# Altium project MCD_Board.PrjPcb (part 2 of 2)

## Sheet Motor_Driver_Sheet.SchDoc
size A4; DocumentNumber: 4; SheetNumber: 5; SheetTotal: 6
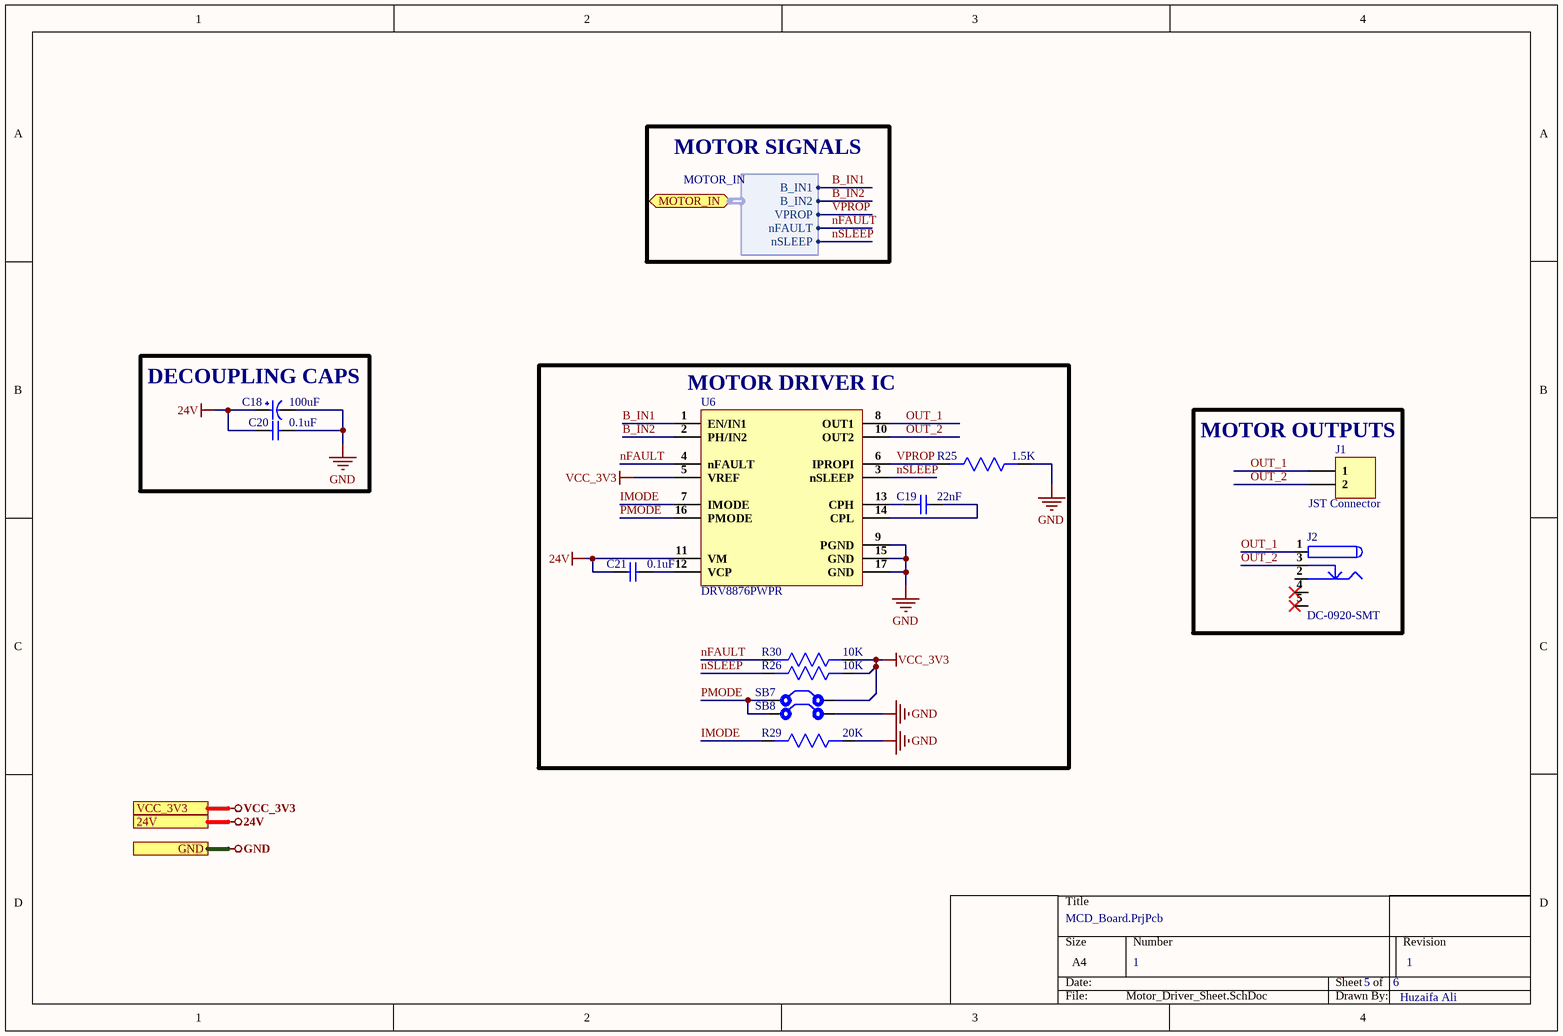
[diagram p3: Motor_Driver_Sheet.SchDoc]

### Parts
C18  100uF  [UWX1E101MCL1GB]
C19  22nF  [Cap 0603]
C20  0.1uF  [Cap 0402]
C21  0.1uF  [Cap 0402]
J1  JST Connector  [JST Connector]
J2  DC-0920-SMT  [DC-0920-SMT]
R25  1.5K  [Res-0201]
R26  10K  [Res0402]
R29  20K  [Res0402]
R30  10K  [Res0402]
SB7  Solder Bridge  [Solder Bridge]  (value not drawn)
SB8  Solder Bridge  [Solder Bridge]  (value not drawn)
U6  DRV8876PWPR  [16HTSSOP]

### Blocks framed on the sheet
DECOUPLING CAPS: C18 C20
MOTOR DRIVER IC: C19 C21 R25 R26 R29 R30 SB7 SB8 U6
MOTOR OUTPUTS: J1 J2

### Ports
24V, GND, MOTOR_IN (bidir, harness MOTOR_IN), VCC_3V3

### Harnesses
MOTOR_IN: B_IN1, B_IN2, VPROP, nFAULT, nSLEEP

### Nets
24V: C18.1 C20.1 C21.1 U6.11(VM) ; port 24V
GND: C18.2 C20.2 R25.1 R29.1 SB8.2 U6.9(PGND) U6.15(GND) U6.17(GND) ; port GND
VCC_3V3: R26.1 R30.1 SB7.2 U6.5(VREF) ; port VCC_3V3
B_IN1: U6.1(EN/IN1) ; port MOTOR_IN.B_IN1
B_IN2: U6.2(PH/IN2) ; port MOTOR_IN.B_IN2
IMODE: R29.2 U6.7(IMODE)
nFAULT: R30.2 U6.4(nFAULT) ; port MOTOR_IN.nFAULT
nSLEEP: R26.2 U6.3(nSLEEP) ; port MOTOR_IN.nSLEEP
OUT_1: J1.1 J2.1 U6.8(OUT1)
OUT_2: J1.2 J2.3 U6.10(OUT2)
PMODE: SB7.1 SB8.1 U6.16(PMODE)
VPROP: R25.2 U6.6(IPROPI) ; port MOTOR_IN.VPROP
NetC19_1: C19.1 U6.13(CPH)
NetC19_2: C19.2 U6.14(CPL)
NetC21_2: C21.2 U6.12(VCP)

Not connected (* = marked no-connect by the designer): J2 2 4* 5*

### Notes on the sheet
- MOTOR SIGNALS
- 1
- Huzaifa Ali

### Library data of the parts
C18 = UWX1E101MCL1GB: CAP ALUM 100UF 20% 25V SMD; Manufacturer: Nichicon; Dielectric Material: Aluminium; Ripple Current: 110mA; Polarity: Polar; Leakage Current: 3uA; Life (Hours): 2000Hour; Dissipation Factor: 0.14%; Lead Diameter: 0.8mm; Supplier 1: Digi-Key; Manufacturer Part Number: UWX1E101MCL1GB; Stock 1: 30613; Pricing 1: 1=0.43, 10=0.301, 50=0.211, 100=0.1808, 500=0.13558 (USD); Mount: Surface Mount; Case/Package: Radial; Number of Pins: 2; Weight: 0.01lb; Min Operating Temperature: -40°C; Max Operating Temperature: 85°C; Capacitance: 100uF; Tolerance: 20%; Ripple Current (AC): 110mA; Voltage Rating: 25V; Packaging: Tape and Reel; Package Quantity: 1000; Voltage Rating (DC): 25V; Termination: SMD/SMT; Voltage: 25V; Series: WX; Construction: Cylindrical; Diameter: 8mm; Length: 5.4mm; Width: 0.25inch; Height: 5.4mm; Lead Pitch: 2.3mm; Height - Seated (Max): 0.213inch; Radiation Hardening: No; REACH SVHC: No SVHC; Lead Free: Lead Free; RoHS Compliant: Yes; ComponentLink1URL: http://nichicon-us.com/english/products/pdfs/e-uwx.pdf?src-supplier=Digi-Key; ComponentLink1Description: http://nichicon-us.com/english/products/pdfs/e-uwx.pdf?src-supplier=Digi-Key; ComponentLink2URL: http://www.nichicon.co.jp/english/products/pdfs/e-ch_ref.pdf?src-supplier=Mouser; ComponentLink2Description: http://www.nichicon.co.jp/english/products/pdfs/e-ch_ref.pdf?src-supplier=Mouser; ComponentLink3URL: http://www.nichicon.co.jp/english/products/pdfs/e-wx.pdf?src-supplier=Avnet; ComponentLink3Description: http://www.nichicon.co.jp/english/products/pdfs/e-wx.pdf?src-supplier=Avnet; ComponentLink4URL: http://uk.rs-online.com/webdocs/0fa3/0900766b80fa3a90.pdf?src-supplier=RSComponents; ComponentLink4Description: http://uk.rs-online.com/webdocs/0fa3/0900766b80fa3a90.pdf?src-supplier=RSComponents; ComponentLink5URL: http://nichicon-us.com/english/products/pdfs/e-wx.pdf?src-supplier=Future+Electronics; ComponentLink5Description: http://nichicon-us.com/english/products/pdfs/e-wx.pdf?src-supplier=Future+Electronics; ComponentLink6URL: http://www.nichicon.co.jp/english/products/pdfs/e-ch_ref.pdf?src-supplier=Avnet+Europe; ComponentLink6Description: http://www.nichicon.co.jp/english/products/pdfs/e-ch_ref.pdf?src-supplier=Avnet+Europe; ComponentLink7URL: http://www.farnell.com/datasheets/2364658.pdf?src-supplier=Element14; ComponentLink7Description: http://www.farnell.com/datasheets/2364658.pdf?src-supplier=Element14; Supplier Part Number 1: 493-2113-6-ND; Supplier 2: Digi-Key; RoHS: Yes; Category: Aluminum Electrolytic Capacitors; Stock 2: 25010; Pricing 2: 1=0.43000, 10=0.30100, 50=0.21100, 100=0.18080, 500=0.13558 (USD); ComponentLink8URL: https://datasheet.ciiva.com/11778/0900766b80fa3a90-11778418.pdf?src-supplier=RSComponents; ComponentLink8Description: https://datasheet.ciiva.com/11778/0900766b80fa3a90-11778418.pdf?src-supplier=RSComponents; ComponentLink9URL: https://datasheet.ciiva.com/17527/e-wx-17527624.pdf?src-supplier=Avnet+Europe; ComponentLink9Description: https://datasheet.ciiva.com/17527/e-wx-17527624.pdf?src-supplier=Avnet+Europe; ComponentLink10URL: https://datasheet.ciiva.com/5361/e-wx-11809-5361100.pdf?src-supplier=Mouser; ComponentLink10Description: https://datasheet.ciiva.com/5361/e-wx-11809-5361100.pdf?src-supplier=Mouser; ComponentLink11URL: https://datasheet.ciiva.com/28458/1912851-28458684.pdf?src-supplier=Element14; ComponentLink11Description: https://datasheet.ciiva.com/28458/1912851-28458684.pdf?src-supplier=Element14; ComponentLink12URL: https://datasheet.ciiva.com/96/e-wx-96650.pdf?src-supplier=Digi-Key; ComponentLink12Description: https://datasheet.ciiva.com/96/e-wx-96650.pdf?src-supplier=Digi-Key; ComponentLink13URL: https://datasheet.ciiva.com/96/e-wx-96651.pdf?src-supplier=Digi-Key; ComponentLink13Description: https://datasheet.ciiva.com/96/e-wx-96651.pdf?src-supplier=Digi-Key; ComponentLink14URL: https://datasheet.ciiva.com/96/e-wx-96652.pdf?src-supplier=Digi-Key; ComponentLink14Description: https://datasheet.ciiva.com/96/e-wx-96652.pdf?src-supplier=Digi-Key; ComponentLink15URL: https://datasheet.ciiva.com/11687/e-wx-11687148.pdf?src-supplier=Avnet; ComponentLink15Description: https://datasheet.ciiva.com/11687/e-wx-11687148.pdf?src-supplier=Avnet; ComponentLink16URL: https://datasheet.ciiva.com/16512/e-wx-16512638.pdf?src-supplier=Future+Electronics; ComponentLink16Description: https://datasheet.ciiva.com/16512/e-wx-16512638.pdf?src-supplier=Future+Electronics; Supplier Part Number 2: 493-2113-1-ND
C19 = CGA3E2X7R2A223K080AA: CAP CER 0.022UF 100V X7R 0603; Manufacturer: TDK; Tolerance: 10%; Supplier 1: Digi-Key; Manufacturer Part Number: CGA3E2X7R2A223K080AA; RoHS: Yes; Category: Ceramic Capacitors; Stock 1: 56079; Pricing 1: 1=0.11000, 10=0.07600, 50=0.04340, 100=0.03590, 500=0.02516, 1000=0.02083 (USD); Mount: Surface Mount; Case/Package: 0603; Case Code (Metric): 1608; Case Code (Imperial): 0603; Weight: 7.1E-05oz; Min Operating Temperature: -55°C; Max Operating Temperature: 125°C; Capacitance: 22nF; Voltage Rating: 100V; Packaging: Tape and Reel; Voltage Rating (DC): 100V; Dielectric: X7R; Termination: SMD/SMT; Series: CGA; Package Quantity: 1; Resistor Type: Ceramic; Length: 1.6mm; Width: 0.031inch; Height: 0.8mm; Thickness: 0.035inch; Depth: 0.8mm; Ratings: AEC-Q200; RoHS Compliant: Yes; REACH SVHC: No SVHC; ComponentLink1URL: https://datasheet.ciiva.com/22725/1735406-22725648.pdf?src-supplier=Element14; ComponentLink1Description: https://datasheet.ciiva.com/22725/1735406-22725648.pdf?src-supplier=Element14; ComponentLink2URL: https://datasheet.ciiva.com/24218/cga3e2x7r2a223k080aa-266292-24218959.pdf?src-supplier=Mouser; ComponentLink2Description: https://datasheet.ciiva.com/24218/cga3e2x7r2a223k080aa-266292-24218959.pdf?src-supplier=Mouser; ComponentLink3URL: https://datasheet.ciiva.com/7975/1807242-7975349.pdf?src-supplier=Element14; ComponentLink3Description: https://datasheet.ciiva.com/7975/1807242-7975349.pdf?src-supplier=Element14; Supplier Part Number 1: 445-5814-1-ND
C20 C21 = CC0402KRX7R7BB104: CAP CER 0.1UF 16V X7R 0402; Manufacturer: Yageo; Tolerance: 10%; Capacitance: 100nF; Supplier 1: Digi-Key; Manufacturer Part Number: CC0402KRX7R7BB104; Stock 1: 16982736; Pricing 1: 1=0.1, 10=0.034, 100=0.015, 500=0.0107, 1000=0.00841, 2500=0.00764, 5000=0.00703 (USD); Mount: Surface Mount; Case/Package: 0402; Number of Pins: 2; Case Code (Metric): 1005; Case Code (Imperial): 0402; Min Operating Temperature: -55°C; Max Operating Temperature: 125°C; Dielectric: X7R; Voltage Rating: 16V; Voltage Rating (DC): 16V; Packaging: Tape and Reel; Package Quantity: 1; Termination: SMD/SMT; Composition: Ceramic; Voltage: 16V; Length: 1mm; Height: 0.5mm; Width: 0.02inch; Thickness: 0.022inch; Depth: 0.5mm; Radiation Hardening: No; REACH SVHC: No SVHC; Lead Free: Lead Free; Halogen Free: Halogen Free; ComponentLink1URL: http://www.yageo.com/documents/recent/UPY-GPHC_X7R_6.3V-to-50V_8.pdf?src-supplier=Avnet+Europe; ComponentLink1Description: http://www.yageo.com/documents/recent/UPY-GPHC_X7R_6.3V-to-50V_8.pdf?src-supplier=Avnet+Europe; ComponentLink2URL: http://www.yageo.com/documents/recent/UPY-GPHC_X7R_6.3V-to-50V_18.pdf?src-supplier=Digi-Key; ComponentLink2Description: http://www.yageo.com/documents/recent/UPY-GPHC_X7R_6.3V-to-50V_18.pdf?src-supplier=Digi-Key; ComponentLink3URL: http://www.yageo.com/documents/recent/UPY-GPHC_X7R_6.3V-to-50V_8.pdf?src-supplier=Avnet; ComponentLink3Description: http://www.yageo.com/documents/recent/UPY-GPHC_X7R_6.3V-to-50V_8.pdf?src-supplier=Avnet; ComponentLink4URL: http://www.yageo.com/documents/recent/UPY-GPHC_X7R_6.3V-to-50V_18.pdf?src-supplier=Mouser; ComponentLink4Description: http://www.yageo.com/documents/recent/UPY-GPHC_X7R_6.3V-to-50V_18.pdf?src-supplier=Mouser; ComponentLink5URL: http://www.farnell.com/datasheets/2167236.pdf?src-supplier=Element14; ComponentLink5Description: http://www.farnell.com/datasheets/2167236.pdf?src-supplier=Element14; ComponentLink6URL: http://www.farnell.com/datasheets/1489800.pdf?src-supplier=Element14; ComponentLink6Description: http://www.farnell.com/datasheets/1489800.pdf?src-supplier=Element14; Supplier Part Number 1: 311-1338-1-ND
J1 = 2 Pin JST Connector
J2 = DC-0920-SMT: Surface Mount DC Power Receptacle 1.2mm 3.7mm SMD AC/DC Power Connectors ROHS; Manufacturer: XKB Connectivity; Manufacturer Part No: DC-0920-SMT; Package: Custom; ComponentLink1Description: LCSC; ComponentLink1URL: https://www.lcsc.com/product-detail/AC-span-style-background-color-ff0-DC-span-Power-Connectors_XKB-Connectivity-DC-0920-SMT_C692456.html
R25 = RMCF0201FT1K50: RES SMD 1.5K OHM 1% 1/20W 0201; Manufacturer: Stackpole Electronics; Resistance: 1.5kR; Max Power Dissipation: 50mW; Temperature Coefficient: 200ppm/°C; Supplier 1: Digi-Key; Manufacturer Part Number: RMCF0201FT1K50; RoHS: Yes; Category: Chip SMD Resistors; Stock 1: 151457; Pricing 1: 1=0.10000, 10=0.02700, 100=0.01090, 1000=0.00488, 2500=0.00423, 5000=0.00350 (USD); Mount: Surface Mount; Case/Package: 0201; Case Code (Metric): 0603; Case Code (Imperial): 0201; Contact Plating: Tin,Matte; Min Operating Temperature: -55°C; Max Operating Temperature: 125°C; Packaging: Tape and Reel; Tolerance: 1%; Resistor Type: Thick Film; Number of Terminations: 2; Series: RMCF; Length: 0.024inch; Width: 0.012inch; Height: 0.009inch; Radiation Hardening: No; RoHS Compliant: Yes; ComponentLink1URL: https://www.seielect.com/Catalog/SEI-RMCF_RMCP.pdf?src-supplier=Digi-Key; ComponentLink1Description: https://www.seielect.com/Catalog/SEI-RMCF_RMCP.pdf?src-supplier=Digi-Key; ComponentLink2URL: https://www.seielect.com/catalog/SEI-Packaging.pdf?src-supplier=Digi-Key; ComponentLink2Description: https://www.seielect.com/catalog/SEI-Packaging.pdf?src-supplier=Digi-Key; ComponentLink3URL: https://www.seielect.com/catalog/SEI-RMCF_RMCP.pdf?src-supplier=Avnet; ComponentLink3Description: https://www.seielect.com/catalog/SEI-RMCF_RMCP.pdf?src-supplier=Avnet; Supplier Part Number 1: RMCF0201FT1K50CT-ND
R26 R30 = RK73B1ETTP103J: RES 10K OHM 5% 1/10W 0402; Manufacturer: KOA Speer; Resistance: 10kR; Power Rating: 63mW; Voltage Rating: 50V; Temperature Coefficient: 200ppm/°C; Supplier 1: Digi-Key; Manufacturer Part Number: RK73B1ETTP103J; Stock 1: 2917894; Pricing 1: 1=0.1, 10=0.016, 100=0.0065, 1000=0.00292, 2500=0.00253, 5000=0.00209 (USD); Mount: Surface Mount; Case/Package: 0402; Case Code (Imperial): 0402; Case Code (Metric): 1005; Min Operating Temperature: -55°C; Max Operating Temperature: 155°C; Packaging: Tape and Reel; Tolerance: 5%; Package Quantity: 10000; Composition: Thick Film; Termination: SMD/SMT; Military Standard: Not; Voltage Rating (DC): 50V; Length: 1mm; Height: 0.35mm; Width: 0.5mm; Depth: 0.5mm; Lead Free: Lead Free; ComponentLink1URL: https://www.verical.com/server-webapp/html/getDatasheet?partID=89073&src-supplier=Verical; ComponentLink1Description: https://www.verical.com/server-webapp/html/getDatasheet?partID=89073&src-supplier=Verical; Supplier Part Number 1: 2019-RK73B1ETTP103JCT-ND
R29 = RC0402JR-0720KL: RES SMD 20K OHM 5% 1/16W 0402; Manufacturer: Yageo; Resistance: 20kR; Power Rating: 62.5mW; Voltage Rating: 50V; Temperature Coefficient: 100ppm/°C; Max Power Dissipation: 63mW; Supplier 1: Digi-Key; Manufacturer Part Number: RC0402JR-0720KL; Stock 1: 4817510; Pricing 1: 1=0.1, 10=0.013, 100=0.0053, 1000=0.00236, 2500=0.00205, 5000=0.00169 (USD); Case/Package: 0402; Number of Pins: 2; Case Code (Metric): 1005; Case Code (Imperial): 0402; Min Operating Temperature: -55°C; Max Operating Temperature: 155°C; Package Quantity: 1; Tolerance: 5%; Packaging: Tape and Reel; Composition: Thick Film; Number of Terminations: 2; Termination: SMD/SMT; Military Standard: Not; Voltage Rating (DC): 50V; Features: Moisture Resistant; Length: 0.039inch; Height: 0.016inch; Width: 0.02inch; Depth: 0.5mm; REACH SVHC: No SVHC; Lead Free: Lead Free; ComponentLink1URL: http://www.yageo.com/documents/recent/PYu-RC_Group_51_RoHS_L_9.pdf?src-supplier=Digi-Key; ComponentLink1Description: http://www.yageo.com/documents/recent/PYu-RC_Group_51_RoHS_L_9.pdf?src-supplier=Digi-Key; ComponentLink2URL: http://www.farnell.com/datasheets/1018594.pdf?src-supplier=Element14; ComponentLink2Description: http://www.farnell.com/datasheets/1018594.pdf?src-supplier=Element14; ComponentLink3URL: http://www.mouser.com/ds/2/447/PYu-RC0402_51_RoHS_L_6_r-8721.pdf?src-supplier=Mouser; ComponentLink3Description: http://www.mouser.com/ds/2/447/PYu-RC0402_51_RoHS_L_6_r-8721.pdf?src-supplier=Mouser; ComponentLink4URL: http://www.yageo.com/documents/recent/PYu-RC0402_51_RoHS_L_6_r.pdf?src-supplier=Future+Electronics; ComponentLink4Description: http://www.yageo.com/documents/recent/PYu-RC0402_51_RoHS_L_6_r.pdf?src-supplier=Future+Electronics; Supplier Part Number 1: 311-20KJRCT-ND
SB7 SB8 = Solder Bridge: Solder Bridge ON
U6 = DRV8876PWPR: IC MOTOR DRIVER DC 5.5V 16HTSSOP; Manufacturer: Texas Instruments; Supplier 1: Digi-Key; Manufacturer Part Number: DRV8876PWPR; RoHS: Yes; Category: Motor Drivers; Pricing 1: 1=2.40000, 10=2.15700, 25=2.03520, 100=1.73400, 250=1.62816, 500=1.42464, 1000=1.34400 (USD); Supplier Part Number 1: 296-53515-6-ND

## Sheet Power_Sheet.SchDoc
size A4; DocumentNumber: 2; SheetNumber: 2; SheetTotal: 6
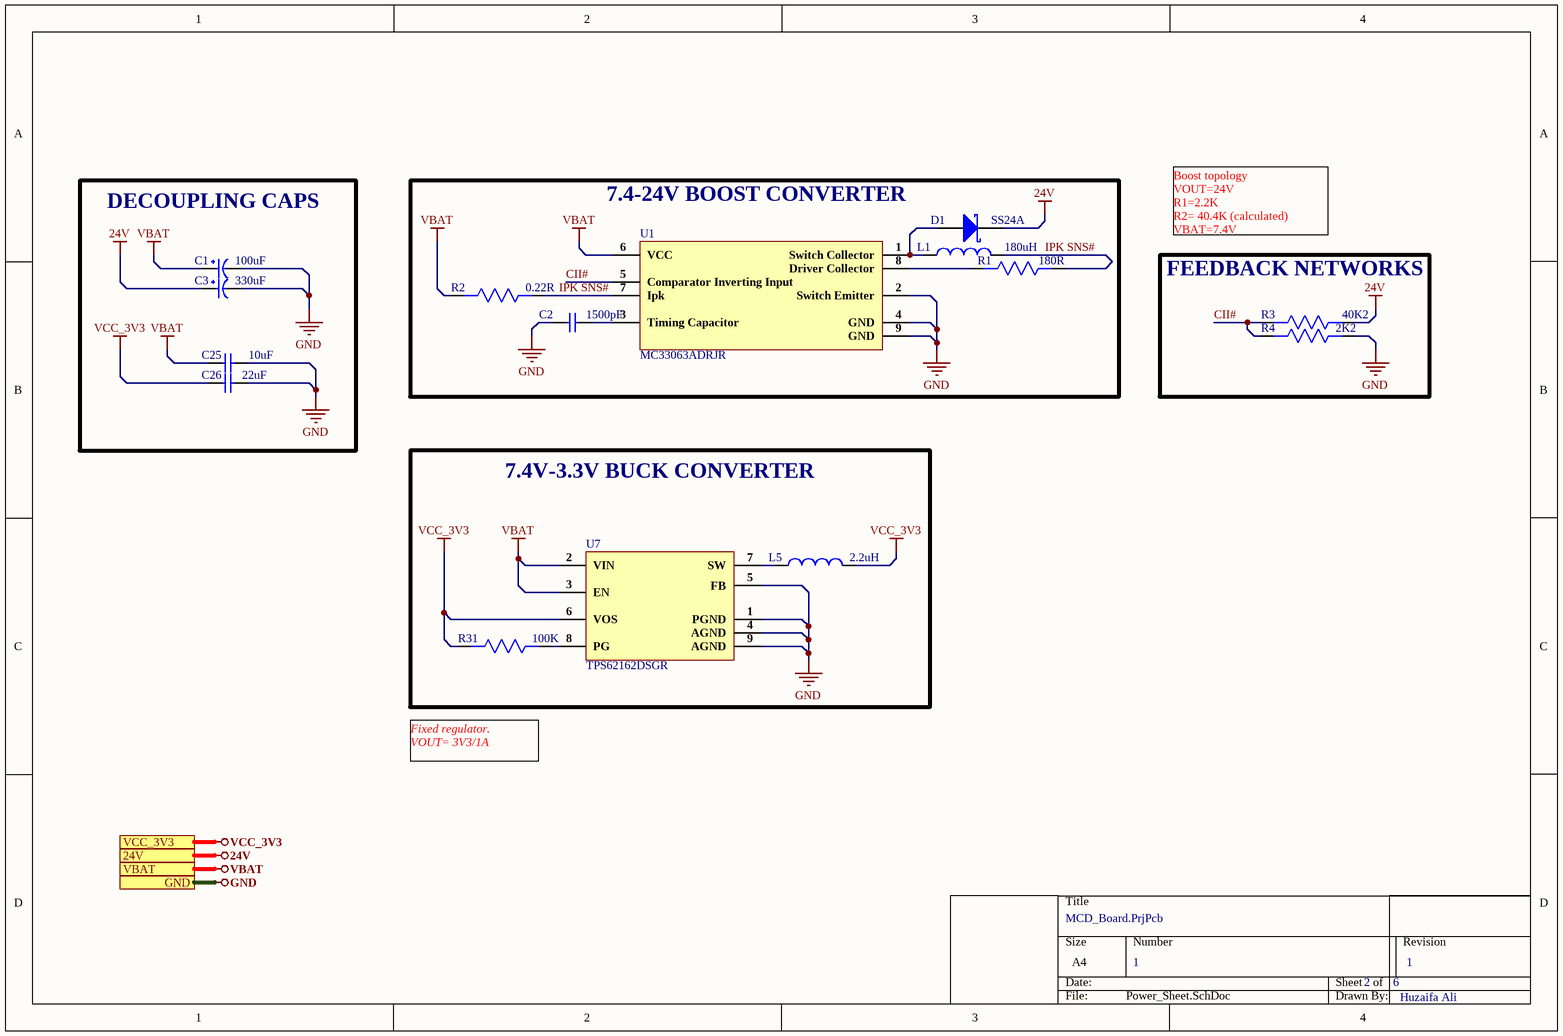
[diagram p4: Power_Sheet.SchDoc]

### Parts
C1  100uF  [UWX1E101MCL1GB]
C2  1500pF  [Cap 0402]
C3  330uF  [UWT1E331MNL1GS]
C25  10uF  [Cap 0603]
C26  22uF  [Cap0805]
D1  SS24A  [SMA]
L1  180uH  [SCD0705T-181K-N]
L5  2.2uH  [MCS20FC-2R2MMP]
R1  180R  [Res0402]
R2  0.22R  [Res0402]
R3  40K2  [Res0603]
R4  2K2  [Cap 0603]
R31  100K  [Res0603]
U1  MC33063ADRJR  [MC33063ADRJR]
U7  TPS62162DSGR  [8-WSON (2x2)]

### Blocks framed on the sheet
DECOUPLING CAPS: C1 C3 C25 C26
7.4-24V BOOST CONVERTER: C2 D1 L1 R1 R2 U1
FEEDBACK NETWORKS: R3 R4
7.4V-3.3V BUCK CONVERTER: L5 R31 U7

### Ports
24V, GND, VBAT, VCC_3V3

### Nets
24V: C3.1 D1.1(K) R3.1 ; port 24V
GND: C1.2 C2.1 C3.2 C25.2 C26.2 R4.1 U1.2(Switch_Emitter) U1.4(GND) U1.9(GND) U7.1(PGND) U7.4(AGND) U7.5(FB) U7.9(AGND) ; port GND
VBAT: C1.1 C25.1 R2.2 U1.6(VCC) U7.2(VIN) U7.3(EN) ; port VBAT
VCC_3V3: C26.1 L5.2 R31.2 U7.6(VOS) ; port VCC_3V3
CII#: R3.2 R4.2 U1.5(Comparator_Inverting_Input)
IPK SNS#: L1.2 R1.1 R2.1 U1.7(Ipk)
NetC2_2: C2.2 U1.3(Timing_Capacitor)
NetD1_2: D1.2(A) L1.1 U1.1(Switch_Collector)
NetL5_1: L5.1 U7.7(SW)
NetR1_2: R1.2 U1.8(Driver_Collector)
NetR31_1: R31.1 U7.8(PG)

### Notes on the sheet
- Boost topology
  VOUT=24V
  R1=2.2K
  R2= 40.4K (calculated)
  VBAT=7.4V
- Text
- Fixed regulator.
  VOUT= 3V3/1A
- 1
- Huzaifa Ali

### Library data of the parts
C1 = UWX1E101MCL1GB: as C18 on sheet Motor_Driver_Sheet; Supplier 1: Digi-Key; Manufacturer Part Number: UWX1E101MCL1GB; Stock 1: 30613; Pricing 1: 1=0.43, 10=0.301, 50=0.211, 100=0.1808, 500=0.13558 (USD); Mount: Surface Mount; Case/Package: Radial; Number of Pins: 2; Weight: 0.01lb; Min Operating Temperature: -40°C; Max Operating Temperature: 85°C; Capacitance: 100uF; Tolerance: 20%; Ripple Current (AC): 110mA; Voltage Rating: 25V; Packaging: Tape and Reel; Package Quantity: 1000; Voltage Rating (DC): 25V; Termination: SMD/SMT; Voltage: 25V; Series: WX; Construction: Cylindrical; Diameter: 8mm; Length: 5.4mm; Width: 0.25inch; Height: 5.4mm; Lead Pitch: 2.3mm; Height - Seated (Max): 0.213inch; Radiation Hardening: No; REACH SVHC: No SVHC; Lead Free: Lead Free; RoHS Compliant: Yes; ComponentLink1URL: http://nichicon-us.com/english/products/pdfs/e-uwx.pdf?src-supplier=Digi-Key; ComponentLink1Description: http://nichicon-us.com/english/products/pdfs/e-uwx.pdf?src-supplier=Digi-Key; ComponentLink2URL: http://www.nichicon.co.jp/english/products/pdfs/e-ch_ref.pdf?src-supplier=Mouser; ComponentLink2Description: http://www.nichicon.co.jp/english/products/pdfs/e-ch_ref.pdf?src-supplier=Mouser; ComponentLink3URL: http://www.nichicon.co.jp/english/products/pdfs/e-wx.pdf?src-supplier=Avnet; ComponentLink3Description: http://www.nichicon.co.jp/english/products/pdfs/e-wx.pdf?src-supplier=Avnet; ComponentLink4URL: http://uk.rs-online.com/webdocs/0fa3/0900766b80fa3a90.pdf?src-supplier=RSComponents; ComponentLink4Description: http://uk.rs-online.com/webdocs/0fa3/0900766b80fa3a90.pdf?src-supplier=RSComponents; ComponentLink5URL: http://nichicon-us.com/english/products/pdfs/e-wx.pdf?src-supplier=Future+Electronics; ComponentLink5Description: http://nichicon-us.com/english/products/pdfs/e-wx.pdf?src-supplier=Future+Electronics; ComponentLink6URL: http://www.nichicon.co.jp/english/products/pdfs/e-ch_ref.pdf?src-supplier=Avnet+Europe; ComponentLink6Description: http://www.nichicon.co.jp/english/products/pdfs/e-ch_ref.pdf?src-supplier=Avnet+Europe; ComponentLink7URL: http://www.farnell.com/datasheets/2364658.pdf?src-supplier=Element14; ComponentLink7Description: http://www.farnell.com/datasheets/2364658.pdf?src-supplier=Element14; Supplier Part Number 1: 493-2113-6-ND; Supplier 2: Digi-Key; RoHS: Yes; Category: Aluminum Electrolytic Capacitors; Stock 2: 25010; Pricing 2: 1=0.43000, 10=0.30100, 50=0.21100, 100=0.18080, 500=0.13558 (USD); ComponentLink8URL: https://datasheet.ciiva.com/11778/0900766b80fa3a90-11778418.pdf?src-supplier=RSComponents; ComponentLink8Description: https://datasheet.ciiva.com/11778/0900766b80fa3a90-11778418.pdf?src-supplier=RSComponents; ComponentLink9URL: https://datasheet.ciiva.com/17527/e-wx-17527624.pdf?src-supplier=Avnet+Europe; ComponentLink9Description: https://datasheet.ciiva.com/17527/e-wx-17527624.pdf?src-supplier=Avnet+Europe; ComponentLink10URL: https://datasheet.ciiva.com/5361/e-wx-11809-5361100.pdf?src-supplier=Mouser; ComponentLink10Description: https://datasheet.ciiva.com/5361/e-wx-11809-5361100.pdf?src-supplier=Mouser; ComponentLink11URL: https://datasheet.ciiva.com/28458/1912851-28458684.pdf?src-supplier=Element14; ComponentLink11Description: https://datasheet.ciiva.com/28458/1912851-28458684.pdf?src-supplier=Element14; ComponentLink12URL: https://datasheet.ciiva.com/96/e-wx-96650.pdf?src-supplier=Digi-Key; ComponentLink12Description: https://datasheet.ciiva.com/96/e-wx-96650.pdf?src-supplier=Digi-Key; ComponentLink13URL: https://datasheet.ciiva.com/96/e-wx-96651.pdf?src-supplier=Digi-Key; ComponentLink13Description: https://datasheet.ciiva.com/96/e-wx-96651.pdf?src-supplier=Digi-Key; ComponentLink14URL: https://datasheet.ciiva.com/96/e-wx-96652.pdf?src-supplier=Digi-Key; ComponentLink14Description: https://datasheet.ciiva.com/96/e-wx-96652.pdf?src-supplier=Digi-Key; ComponentLink15URL: https://datasheet.ciiva.com/11687/e-wx-11687148.pdf?src-supplier=Avnet; ComponentLink15Description: https://datasheet.ciiva.com/11687/e-wx-11687148.pdf?src-supplier=Avnet; ComponentLink16URL: https://datasheet.ciiva.com/16512/e-wx-16512638.pdf?src-supplier=Future+Electronics; ComponentLink16Description: https://datasheet.ciiva.com/16512/e-wx-16512638.pdf?src-supplier=Future+Electronics; Supplier Part Number 2: 493-2113-1-ND
C2 = CL05B152KB5NNNC: CAP CER 1500PF 50V X7R 0402; Manufacturer: Samsung; Material: Ceramic; Tolerance: 10%; Capacitance: 1.5nF; Supplier 1: RSComponents; Manufacturer Part Number: CL05B152KB5NNNC; RoHS: Yes; Category: Ceramic Capacitors; Stock 1: 20000; Pricing 1: 10000=0.00400, 30000=0.00400, 50000=0.00400, 100000=0.00300, 250000=0.00300 (USD); Mount: Surface Mount; Case/Package: 0402; Case Code (Metric): 1005; Case Code (Imperial): 0402; Contact Plating: Tin; Min Operating Temperature: -55°C; Max Operating Temperature: 125°C; Package Quantity: 1; Packaging: Tape and Reel; Voltage Rating: 50V; Dielectric: X7R; Series: CL; Construction: Flat; Voltage: 50V; Length: 1mm; Width: 0.02inch; Height: 0.5mm; Thickness: 0.022inch; Depth: 0.5mm; Radiation Hardening: No; RoHS Compliant: Yes; ComponentLink1URL: https://datasheet.ciiva.com/16498/cl05b152kb5nnnc-16498493.pdf?src-supplier=Future+Electronics; ComponentLink1Description: https://datasheet.ciiva.com/16498/cl05b152kb5nnnc-16498493.pdf?src-supplier=Future+Electronics; ComponentLink2URL: https://datasheet.ciiva.com/15195/getdatasheetpartid-543173-15195639.pdf?src-supplier=Verical; ComponentLink2Description: https://datasheet.ciiva.com/15195/getdatasheetpartid-543173-15195639.pdf?src-supplier=Verical; ComponentLink3URL: https://datasheet.ciiva.com/29198/459134-da-01-en-vs-kondensator-0402-29198336.pdf?src-supplier=Conrad; ComponentLink3Description: https://datasheet.ciiva.com/29198/459134-da-01-en-vs-kondensator-0402-29198336.pdf?src-supplier=Conrad; ComponentLink4URL: https://datasheet.ciiva.com/26309/mlcc-catalogdownload2013-eng-26309021.pdf?src-supplier=Distrelec; ComponentLink4Description: https://datasheet.ciiva.com/26309/mlcc-catalogdownload2013-eng-26309021.pdf?src-supplier=Distrelec; Supplier Part Number 1: 7661526
C3 = UWT1E331MNL1GS: CAP ALUM 330UF 20% 25V SMD; Manufacturer: Nichicon; Dielectric Material: Aluminium; Ripple Current: 190mA; Leakage Current: 3uA; Life (Hours): 1000Hour; Dissipation Factor: 0.16%; Supplier 1: Newark; Manufacturer Part Number: UWT1E331MNL1GS; RoHS: Yes; Category: Aluminum Electrolytic Capacitors; Pricing 1: 1=0.75000, 10=0.53800, 25=0.47600, 50=0.41500, 100=0.35400 (USD); Mount: Surface Mount,PCB; Case/Package: Radial; Number of Pins: 2; Min Operating Temperature: -55°C; Max Operating Temperature: 105°C; Package Quantity: 500; Capacitance: 330uF; Voltage Rating: 25V; Tolerance: 20%; Packaging: Tape and Reel; Voltage Rating (DC): 25V; Termination: SMD/SMT; Voltage: 25V; Ripple Current (AC): 190mA; Series: WT; Construction: Cylindrical; Diameter: 8mm; Length: 10mm; Height: 10mm; Height - Seated (Max): 0.394inch; Radiation Hardening: No; REACH SVHC: No SVHC; Lead Free: Lead Free; RoHS Compliant: Yes; ComponentLink1URL: https://datasheet.ciiva.com/97/e-wt-97107.pdf?src-supplier=Digi-Key; ComponentLink1Description: https://datasheet.ciiva.com/97/e-wt-97107.pdf?src-supplier=Digi-Key; ComponentLink2URL: https://datasheet.ciiva.com/30522/getdatasheetpartid-457641-30522227.pdf?src-supplier=Verical; ComponentLink2Description: https://datasheet.ciiva.com/30522/getdatasheetpartid-457641-30522227.pdf?src-supplier=Verical; ComponentLink3URL: https://datasheet.ciiva.com/97/e-wt-97108.pdf?src-supplier=Digi-Key; ComponentLink3Description: https://datasheet.ciiva.com/97/e-wt-97108.pdf?src-supplier=Digi-Key; ComponentLink4URL: https://datasheet.ciiva.com/97/e-wt-97109.pdf?src-supplier=Digi-Key; ComponentLink4Description: https://datasheet.ciiva.com/97/e-wt-97109.pdf?src-supplier=Digi-Key; ComponentLink5URL: https://datasheet.ciiva.com/11782/0900766b80649b51-11782007.pdf?src-supplier=RSComponents; ComponentLink5Description: https://datasheet.ciiva.com/11782/0900766b80649b51-11782007.pdf?src-supplier=RSComponents; ComponentLink6URL: https://datasheet.ciiva.com/11686/e-wt-11686502.pdf?src-supplier=Avnet; ComponentLink6Description: https://datasheet.ciiva.com/11686/e-wt-11686502.pdf?src-supplier=Avnet; ComponentLink7URL: https://datasheet.ciiva.com/16502/e-wt-16502936.pdf?src-supplier=Future+Electronics; ComponentLink7Description: https://datasheet.ciiva.com/16502/e-wt-16502936.pdf?src-supplier=Future+Electronics; ComponentLink8URL: https://datasheet.ciiva.com/7851/e-wt-7851757.pdf?src-supplier=Element14; ComponentLink8Description: https://datasheet.ciiva.com/7851/e-wt-7851757.pdf?src-supplier=Element14; Supplier Part Number 1: 58R3568
C25 = CL10A106MA8NRNC: CAP CER 10UF 25V X5R 0603; Manufacturer: Samsung; Tolerance: 20%; Supplier 1: Avnet; Manufacturer Part Number: CL10A106MA8NRNC; RoHS: Yes; Category: Ceramic Capacitors; Pricing 1: 4000=0.03753, 8000=0.03700, 16000=0.03595, 24000=0.03515, 32000=0.03383, 40000=0.03304, 400000=0.03225 (USD); Mount: Surface Mount; Case/Package: 0603; Case Code (Metric): 1608; Case Code (Imperial): 0603; Contact Plating: Tin; Min Operating Temperature: -55°C; Max Operating Temperature: 85°C; Package Quantity: 1; Packaging: Tape and Reel; Capacitance: 10uF; Voltage Rating: 25V; Dielectric: X5R; Termination: Wraparound; Series: CL; Construction: Flat; Length: 0.063inch; Width: 0.031inch; Thickness: 0.035inch; Lead Free: Lead Free; RoHS Compliant: Yes; ComponentLink1URL: https://datasheet.ciiva.com/25766/cl10a106ma8nrnc-25766562.pdf?src-supplier=Digi-Key; ComponentLink1Description: https://datasheet.ciiva.com/25766/cl10a106ma8nrnc-25766562.pdf?src-supplier=Digi-Key; Supplier Part Number 1: CL10A106MA8NRNC
C26 = CC0805MKX5R8BB226: CAP CER 22UF 25V X5R 0805; Manufacturer: Yageo; Tolerance: 20%; Supplier 1: Digi-Key; Manufacturer Part Number: CC0805MKX5R8BB226; RoHS: Yes; Category: Ceramic Capacitors; Stock 1: 64970; Pricing 1: 1=0.47000, 10=0.33300, 50=0.25140, 100=0.21900, 500=0.16222, 1000=0.13789 (USD); Mount: Surface Mount; Case/Package: 0805; Case Code (Metric): 2012; Case Code (Imperial): 0805; Weight: 0.000194oz; Min Operating Temperature: -55°C; Max Operating Temperature: 85°C; Packaging: Tape and Reel; Capacitance: 22uF; Voltage Rating: 25V; Dielectric: X5R; Termination: SMD/SMT; Voltage Rating (DC): 25V; Package Quantity: 3000; Length: 0.079inch; Width: 0.049inch; Height: 1.25mm; Thickness: 0.057inch; Lead Free: Lead Free; Halogen Free: Halogen Free; RoHS Compliant: Yes; ComponentLink1URL: http://www.mouser.com/ds/2/447/Yageo_UPY-GP_NP0_16V-to-50V_9-358835.pdf?src-supplier=Mouser; ComponentLink1Description: http://www.mouser.com/ds/2/447/Yageo_UPY-GP_NP0_16V-to-50V_9-358835.pdf?src-supplier=Mouser; ComponentLink2URL: http://www.yageo.com/documents/recent/UPY-GPHC_X5R_4V-to-50V_25.pdf?src-supplier=Digi-Key; ComponentLink2Description: http://www.yageo.com/documents/recent/UPY-GPHC_X5R_4V-to-50V_25.pdf?src-supplier=Digi-Key; Supplier Part Number 1: 311-1903-1-ND
D1 = SS24A: 40V 500mV@2A 2A SMA(DO-214AC) Schottky Barrier Diodes (SBD) ROHS; Manufacturer: Yangzhou; Manufacturer Part No: SS24A; Package: SMA(DO-214AC)
L1 = SCD0705T-181K-N: 510mA 180uH ±10% 710mΩ SMD Power Inductors ROHS
L5 = MCS20FC-2R2MMP: IND SMD 1.5A 2.2uH ±20% 135mΩ
R1 = AR02BTC1800: ±0.1% 1/16W Thin Film Resistor 25V ±25ppm/℃ -55℃~+155℃ 180Ω 0402 Chip Resistor - Surface Mount ROHS; Manufacturer: Viking Tech; Manufacturer Part No: AR02BTC1800; Value: 180R; Package: 0402; ComponentLink1Description: LCSC; ComponentLink1URL: https://www.lcsc.com/product-detail/Chip-span-style-background-color-ff0-Resistor-span-Surface-Mount_Viking-Tech-AR02BTC1800_C317910.html
R2 = PT0402FR-7W0R22L: RES 0.22 OHM 1% 1/8W 0402; Manufacturer: Yageo; Max Power Dissipation: 125mW; Temperature Coefficient: 200ppm/°C; Resistance: 220mR; Supplier 1: RSComponents; Manufacturer Part Number: PT0402FR-7W0R22L; RoHS: Yes; Category: Chip SMD Resistors; Stock 1: 7650; Pricing 1: 100=0.22700, 250=0.20800, 500=0.19300, 1000=0.16600 (GBP); Case/Package: 0402; Min Operating Temperature: -55°C; Max Operating Temperature: 155°C; Tolerance: 1%; Features: Moisture Resistant,Automotive AEC-Q200; Packaging: Tape and Reel; Resistor Type: Thick Film; Number of Terminations: 2; Length: 0.039inch; Width: 0.02inch; Height: 0.016inch; ComponentLink1URL: http://www.mouser.com/ds/2/447/yageodocoutput-1101729.pdf?src-supplier=Mouser; ComponentLink1Description: http://www.mouser.com/ds/2/447/yageodocoutput-1101729.pdf?src-supplier=Mouser; ComponentLink2URL: http://www.yageo.com/documents/recent/PYu-PT-Group_521_RoHS_L-1.pdf?src-supplier=Digi-Key; ComponentLink2Description: http://www.yageo.com/documents/recent/PYu-PT-Group_521_RoHS_L-1.pdf?src-supplier=Digi-Key; Supplier Part Number 1: 1996006P
R3 = RC0603FR-0740K2L: 贴片电阻 40200Ω ± 1.00% 0.1W ± 100ppm/℃ 0603; Manufacturer: Yageo; Resistance: 40.2kR; Tolerance: 1%; Power Rating: 100mW; Voltage Rating: 50V; Temperature Coefficient: 100ppm/°C; Working Voltage: 75V; Supplier 1: Newark; Manufacturer Part Number: RC0603FR-0740K2L; RoHS: Yes; Category: Chip SMD Resistors; Stock 1: 81670; Pricing 1: 1=0.06100, 10=0.01200, 25=0.00900, 50=0.00700, 100=0.00500 (USD); Mount: Surface Mount; Case/Package: 0603; Case Code (Imperial): 0603; Case Code (Metric): 1608; Min Operating Temperature: -55°C; Max Operating Temperature: 155°C; Packaging: Tape and Reel; Termination: SMD/SMT; Resistor Type: Thick Film; Voltage Rating (DC): 50V; Number of Terminations: 2; Features: Moisture Resistant; Series: RC; Max Power Dissipation: 100mW; Construction: Rectangular; Technology: METAL OXIDE FILM; Length: 1.6mm; Width: 0.8mm; Height: 0.45mm; Depth: 0.8mm; Military Standard: Not; Lead Free: Lead Free; RoHS Compliant: Yes; ComponentLink1URL: https://datasheet.ciiva.com/11809/0900766b80f96399-11809261.pdf?src-supplier=RSComponents; ComponentLink1Description: https://datasheet.ciiva.com/11809/0900766b80f96399-11809261.pdf?src-supplier=RSComponents; ComponentLink2URL: https://datasheet.ciiva.com/12555/rc0603-272842-12555385.pdf?src-supplier=Mouser; ComponentLink2Description: https://datasheet.ciiva.com/12555/rc0603-272842-12555385.pdf?src-supplier=Mouser; Supplier Part Number 1: 82AH8157
R4 = AC0603JR-072K2L: RES SMD 2200Ω ± 5.00% 0.1W ± 100ppm/℃ 0603; Manufacturer: Yageo; Resistance: 2.2kR; Tolerance: 5%; Temperature Coefficient: 100ppm/°C; Power Rating: 100mW; Voltage Rating: 50V; Supplier 1: RSComponents; Manufacturer Part Number: AC0603JR-072K2L; RoHS: Yes; Category: Chip SMD Resistors; Stock 1: 9000; Pricing 1: 5000=0.00200 (GBP); Case/Package: 0603; Contact Plating: Tin,Matte; Case Code (Imperial): 0603; Case Code (Metric): 1608; Min Operating Temperature: -55°C; Max Operating Temperature: 155°C; Resistor Type: Thick Film; Packaging: Tape and Reel; Termination: SMD/SMT; Number of Terminations: 2; Max Power Dissipation: 100mW; Features: Moisture Resistant,Automotive AEC-Q200; Series: AC; Length: 0.063inch; Width: 0.8mm; Height: 0.022inch; Radiation Hardening: No; Lead Free: Lead Free; RoHS Compliant: Yes; ComponentLink1URL: http://www.mouser.com/ds/2/447/yageodocoutput-1111992.pdf?src-supplier=Mouser; ComponentLink1Description: http://www.mouser.com/ds/2/447/yageodocoutput-1111992.pdf?src-supplier=Mouser; ComponentLink2URL: http://www.yageo.com/NewPortal/yageodocoutput?fileName=/pdf/R-Chip/PYu-AC_51_RoHS_L_6.pdf&src-supplier=Digi-Key; ComponentLink2Description: http://www.yageo.com/NewPortal/yageodocoutput?fileName=/pdf/R-Chip/PYu-AC_51_RoHS_L_6.pdf&src-supplier=Digi-Key; ComponentLink3URL: https://www.yageo.com/upload/media/product/productsearch/datasheet/rchip/PYu-AC_51_RoHS_L_7.pdf?src-supplier=Digi-Key; ComponentLink3Description: https://www.yageo.com/upload/media/product/productsearch/datasheet/rchip/PYu-AC_51_RoHS_L_7.pdf?src-supplier=Digi-Key; Supplier Part Number 1: 1978135
R31 = CRGH0603J100K: RES SMD 100K OHM 5% 1/5W 0603; Manufacturer: TE Connectivity; Resistance: 100kR; Temperature Coefficient: 100ppm/°C; Power Rating: 200mW; Voltage Rating: 50V; Number of Resistors: 1; Supplier 1: Digi-Key; Manufacturer Part Number: CRGH0603J100K; Stock 1: 23277; Pricing 1: 1=0.1, 10=0.049, 100=0.02, 1000=0.00899, 2500=0.0078 (USD); Mount: Surface Mount; Case/Package: 0603; Case Code (Imperial): 0603; Case Code (Metric): 1608; Min Operating Temperature: -55°C; Max Operating Temperature: 125°C; Tolerance: 5%; Packaging: Tape and Reel; Resistor Type: Thick Film,Power resistor; Number of Terminations: 2; Series: CRGH; Termination: Solder; Voltage Rating (DC): 50V; Resistance Tolerance: 5%; Technology: THICK FILM; Length: 1.6mm; Width: 0.8mm; Height: 0.45mm; Depth: 0.8mm; RoHS Compliant: Yes; REACH SVHC: No SVHC; ELV: Compliant; ComponentLink1URL: http://www.farnell.com/datasheets/2007183.pdf?src-supplier=Element14; ComponentLink1Description: http://www.farnell.com/datasheets/2007183.pdf?src-supplier=Element14; Supplier Part Number 1: A126393DKR-ND
U1 = MC33063ADRJR: IC REG BUCK BST ADJ 1.5A 8SON; Manufacturer: Texas Instruments; Switching Frequency: 100kHz; Output Voltage: 40V; Number of Outputs: 1; Max Output Current: 750mA; Min Input Voltage: 3V; Min Output Voltage: 1.25V; Synchronous Rectifier: No; Quiescent Current: 4mA; Topology: Flyback,SEPIC; Output Type: Adjustable; Supplier 1: Mouser; Manufacturer Part Number: MC33063ADRJR; RoHS: Yes; Category: Voltage Regulators - Switching; Pricing 1: 1=0.80000, 10=0.70000, 50=0.70000, 100=0.53700, 250=0.49900, 1000=0.33900, 10000=0.33900 (USD); Case/Package: SON; Number of Pins: 8; Min Operating Temperature: -40°C; Max Operating Temperature: 85°C; Output Current: 1.5A; Packaging: Tape and Reel; Package Quantity: 1; Max Input Voltage: 40V; Max Output Voltage: 40V; Series: -; Length: 4.1mm; Width: 4.1mm; Height: 0.75mm; Radiation Hardening: No; Lead Free: Lead Free; RoHS Compliant: Yes; REACH SVHC: No SVHC; ComponentLink1URL: https://datasheet.ciiva.com/15113/getdatasheetpartid-174233-15113668.pdf?src-supplier=Verical; ComponentLink1Description: https://datasheet.ciiva.com/15113/getdatasheetpartid-174233-15113668.pdf?src-supplier=Verical; ComponentLink2URL: https://datasheet.ciiva.com/46382/1887492-46382423.pdf?src-supplier=Element14; ComponentLink2Description: https://datasheet.ciiva.com/46382/1887492-46382423.pdf?src-supplier=Element14; ComponentLink3URL: https://datasheet.ciiva.com/2029/mc33063a-2029334.pdf?src-supplier=Digi-Key; ComponentLink3Description: https://datasheet.ciiva.com/2029/mc33063a-2029334.pdf?src-supplier=Digi-Key; ComponentLink4URL: https://datasheet.ciiva.com/2029/mc33063a-2029335.pdf?src-supplier=Digi-Key; ComponentLink4Description: https://datasheet.ciiva.com/2029/mc33063a-2029335.pdf?src-supplier=Digi-Key; ComponentLink5URL: https://datasheet.ciiva.com/3218/mc33063a-3218541.pdf?src-supplier=Avnet; ComponentLink5Description: https://datasheet.ciiva.com/3218/mc33063a-3218541.pdf?src-supplier=Avnet; Supplier Part Number 1: 595-MC33063ADRJR
U7 = TPS62162DSGR: Buck Switching Regulator IC Positive Fixed 3.3V 1 Output 1A 8-WFDFN Exposed Pad; Manufacturer: Texas Instruments; Number of Outputs: 1; Max Input Voltage: 17V; Min Input Voltage: 3V; Switching Frequency: 2.25MHz; Synchronous Rectifier: Yes; Quiescent Current: 17uA; Supplier 1: Mouser; Manufacturer Part Number: TPS62162DSGR; RoHS: Yes; Category: Voltage Regulators - Switching; Pricing 1: 1=1.59000, 10=1.44000, 25=1.36000, 50=1.36000, 100=1.16000, 250=1.09000, 500=0.94700, 1000=0.78500, 10000=0.78400 (USD); Case/Package: SOIC; Number of Pins: 8; Contact Plating: Gold; Min Operating Temperature: -40°C; Max Operating Temperature: 125°C; Output Voltage: 3.3V; Packaging: Tape and Reel; Output Current: 1A; Package Quantity: 3000; Max Output Current: 1A; Min Output Voltage: 3.3V; Max Output Voltage: 3.3V; Operating Supply Voltage: 17V; Output Type: Fixed; Output Configuration: Positive; Series: DCS-Control™; Radiation Hardening: No; Lead Free: Lead Free; RoHS Compliant: Yes; ComponentLink1URL: https://datasheet.ciiva.com/2034/tps62161-2034675.pdf?src-supplier=Digi-Key; ComponentLink1Description: https://datasheet.ciiva.com/2034/tps62161-2034675.pdf?src-supplier=Digi-Key; Supplier Part Number 1: 595-TPS62162DSGR

## Sheet Connector_Sheet.SchDoc
size A4; DocumentNumber: 5; SheetNumber: 6; SheetTotal: 6
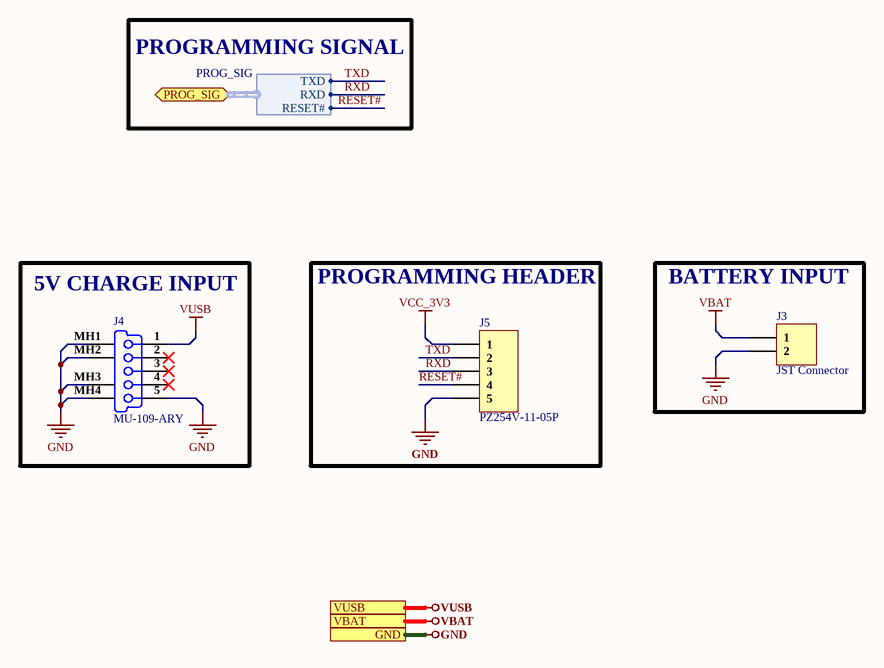
[diagram p5: Connector_Sheet.SchDoc]

### Parts
J3  JST Connector  [JST Connector]
J4  MU-109-ARY  [MU-109-ARY]
J5  PZ254V-11-05P  [PZ254V-11-05P]

### Blocks framed on the sheet
5V CHARGE INPUT: J4
PROGRAMMING HEADER: J5
BATTERY INPUT: J3

### Ports
GND, PROG_SIG (bidir, harness PROG_SIG), VBAT, VUSB

### Harnesses
PROG_SIG: TXD, RXD, RESET#

### Nets
GND: J3.2 J4.5(GND) J4.MH1(Tab) J4.MH2(Tab) J4.MH3(Tab) J4.MH4(Tab) J5.5 ; port GND
VBAT: J3.1 ; port VBAT
VCC_3V3: J5.1
VUSB: J4.1(V_BUS_(5V)) ; port VUSB
RESET#: J5.4 ; port PROG_SIG.RESET#
RXD: J5.3 ; port PROG_SIG.RXD
TXD: J5.2 ; port PROG_SIG.TXD

Not connected (* = marked no-connect by the designer): J4 2(D-)* 3(D+)* 4(ID)*

### Notes on the sheet
- PROGRAMMING SIGNAL
- 1
- Huzaifa Ali

### Library data of the parts
J3 = 2 Pin JST Connector
J4 = MU-109-ARY: 1.5A USB 2.0 1 Sink board 5 Female -20℃~+70℃ Micro-B SMD USB Connectors ROHS; Manufacturer: XUNPU; Manufacturer Part No: MU-109-ARY; Package: Custom; ComponentLink1Description: LCSC; ComponentLink1URL: https://lcsc.com/product-detail/span-style-background-color-ff0-USB-span-Connectors_XUNPU-MU-109-ARY_C720609.html
J5 = PZ254V-11-05P: Pin Header 5 1 right-angle; Manufacturer: XFCN; Brand Category: Made In Asia Brands; Pitch: 2.54; Packaging: Bag-packed; Connector Type: Pin Header; Number of Pins: 5; Number of Rows: 1

## Nets that join several sheets
24V: Motor_Driver_Sheet (C18.1 C20.1 C21.1 U6.11), Power_Sheet (C3.1 D1.1 R3.1)
GND: Battery_Charging_Sheet (24 pins), Controller_Sheet (10 pins), Motor_Driver_Sheet (8 pins), Power_Sheet (13 pins), Connector_Sheet (7 pins)
VBAT: Battery_Charging_Sheet (5 pins), Power_Sheet (6 pins), Connector_Sheet (J3.1)
VCC_3V3: Battery_Charging_Sheet (R28.2), Controller_Sheet (6 pins), Motor_Driver_Sheet (R26.1 R30.1 SB7.2 U6.5), Power_Sheet (C26.1 L5.2 R31.2 U7.6), Connector_Sheet (J5.1)
VUSB: Battery_Charging_Sheet (13 pins), Connector_Sheet (J4.1)
~{PG}: Battery_Charging_Sheet (Q2.3 R28.1), Controller_Sheet (U5.9)
B_IN1: Controller_Sheet (U5.1), Motor_Driver_Sheet (U6.1)
B_IN2: Controller_Sheet (U5.5), Motor_Driver_Sheet (U6.2)
nFAULT: Controller_Sheet (U5.7), Motor_Driver_Sheet (R30.2 U6.4)
nSLEEP: Controller_Sheet (U5.8), Motor_Driver_Sheet (R26.2 U6.3)
RESET#: Controller_Sheet (R21.2), Connector_Sheet (J5.4)
RXD: Controller_Sheet (U5.11), Connector_Sheet (J5.3)
TXD: Controller_Sheet (U5.12), Connector_Sheet (J5.2)
VPROP: Controller_Sheet (U5.6), Motor_Driver_Sheet (R25.2 U6.6)